# Altium project PCB_Project.PrjPcb
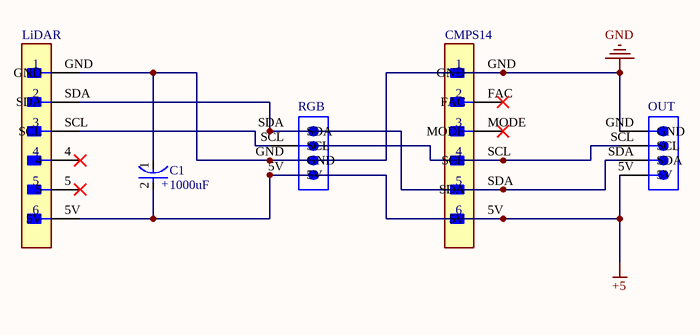
[diagram p0: Sheet1.SchDoc]
1 sheet, 5 parts. Net scope: global (net labels, ports and power ports of the same name join across sheets).
Board file: PCB1.PcbDoc

## Sheet Sheet1.SchDoc
size A4; SheetNumber: 1; SheetTotal: 1

### Parts
C1  1000uF  [FP-RAD-TH-D_10_0_5-L_16_1-MFG]
CMPS14  22-28-4060  [FP-22-28-4060-MFG]  (value not drawn)
LiDAR  22-28-4060  [FP-22-28-4060-MFG]  (value not drawn)
OUT  61300411121  [61300411121]  (value not drawn)
RGB  61300411121  [61300411121]  (value not drawn)

### Nets
+5: C1.2(A) CMPS14.5V LiDAR.5V OUT.5V RGB.5V
GND: C1.1(C) CMPS14.GND LiDAR.GND OUT.GND RGB.GND
NetCMPS14_SCL: CMPS14.SCL OUT.SCL
NetCMPS14_SDA: CMPS14.SDA LiDAR.SDA OUT.SDA RGB.SDA
NetLiDAR_SCL: LiDAR.SCL RGB.SCL

Not connected (* = marked no-connect by the designer): CMPS14 FAC* MODE*; LiDAR 4* 5*

### Notes on the sheet
- (in symbol CMP-04776-000763-1) 2; 3; 4; 5
- (in symbol CMP-05427-001524-1) +

### Library data of the parts
C1 = CMP-05427-001524-1: Aluminum Electrolytic Capacitors (Radial Lead Type) 1000uF ±20% 16V; Life (Hours): 2000Hour; Ripple Current (AC): 680mA; Polarity: Polar; Lead/Base Style: Straight; Lead Diameter: 0.6mm; Capacitance: 1mF; Leakage Current: 3uA; Dissipation Factor: 0.2%; Construction: RADIAL; Height: 16mm; Ripple Current: 680mA; Size: 16mm; Radiation Hardening: No; Min Operating Temperature: -40°C; Contact Plating: Tin; Mount: Through Hole; Termination: Radial; Width: 0inch; Max Operating Temperature: 85°C; RoHS Compliant: Yes; Length: 16mm; Voltage Rating: 16V; Lead Pitch: 5mm; Height - Seated (Max): 0.669inch; Voltage: 16V; Tolerance: 20%; Series: M; Packaging: Bulk; Package Quantity: 200; Number of Pins: 2; Case/Package: Radial; Diameter: 10mm; REACH SVHC: No SVHC; Voltage Rating (DC): 16V
CMPS14 LiDAR = CMP-04776-000763-1: CONN HEADER VERT 6POS 2.54MM; Voltage Rating: 250V; Current Rating: 4A; Number of Contacts: 6; Max Voltage Rating (DC): 250.25kV; Gender: Male; Contact Resistance: 20mR; Connector Type: Male Pin; Color: Black; Max Voltage Rating (AC): 250V; Pitch: 2.54mm; Orientation: Straight; Max Operating Temperature: 75°C; Contact Plating: Tin; Depth: 2.49mm; Contact Type: Male Pin; Number of Positions: 6; Length: 15.24mm; Packaging: Bulk; Mount: Through Hole; Housing Material: Thermoplastic; Housing Color: Black; Termination: Solder; Contact Material: Brass; Min Operating Temperature: 0°C; Series: KK® 42375; Number of Rows: 1; Package Quantity: 1; RoHS Compliant: Yes; Contact Mating Length: 0.24inch
OUT RGB = CMP-1502-01064-3: NexarPartId: 32855522; Operating Supply Voltage: 250V; Pitch: 2.54mm; Contact Resistance: 20mΩ; Number of Positions: 4; Current Rating: 3A; Connector Type: Male Pin; Gender: Male; Contact Plating: Gold; Height: 8.89mm; Lead Pitch: 2.54mm; Lead Free: Lead Free; Contact Mating Length: 5.9944mm; Number of Rows: 1; Termination: Solder; Packaging: Bulk; REACH SVHC: Unknown; Min Operating Temperature: -40°C; RoHS: Compliant; Number of Contacts: 4; Voltage Rating: 250V; Color: Black; Max Operating Temperature: 105°C; Contact Material: Copper; Mount: Through Hole; Orientation: Vertical; Number of Pins: 4